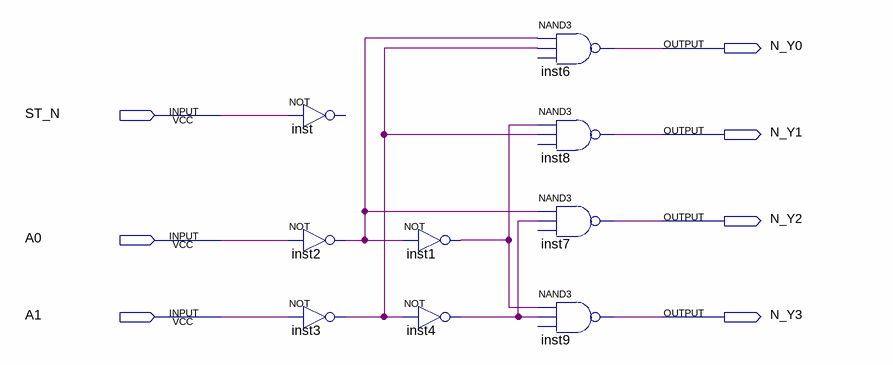
[diagram p0: schematic sheet]
// Quartus schematic 2-4.bdf as structural Verilog: 9 symbols, 7 pins
module \2-4  (
  input  ST_N,
  input  A0,
  input  A1,
  output N_Y0,
  output N_Y1,
  output N_Y2,
  output N_Y3
);

  wire inst1_out, inst2_out, inst3_out, inst4_out;

  // NOT inst has open pins: IN=ST_N, OUT=open
  not inst2 (inst2_out, A0);
  not inst3 (inst3_out, A1);
  not inst1 (inst1_out, inst2_out);
  not inst4 (inst4_out, inst3_out);
  nand inst6 (N_Y0, inst2_out, inst3_out);  // open: IN3
  nand inst8 (N_Y1, inst1_out, inst3_out);  // open: IN3
  nand inst7 (N_Y2, inst2_out, inst4_out);  // open: IN3
  nand inst9 (N_Y3, inst1_out, inst4_out);  // open: IN3
endmodule
